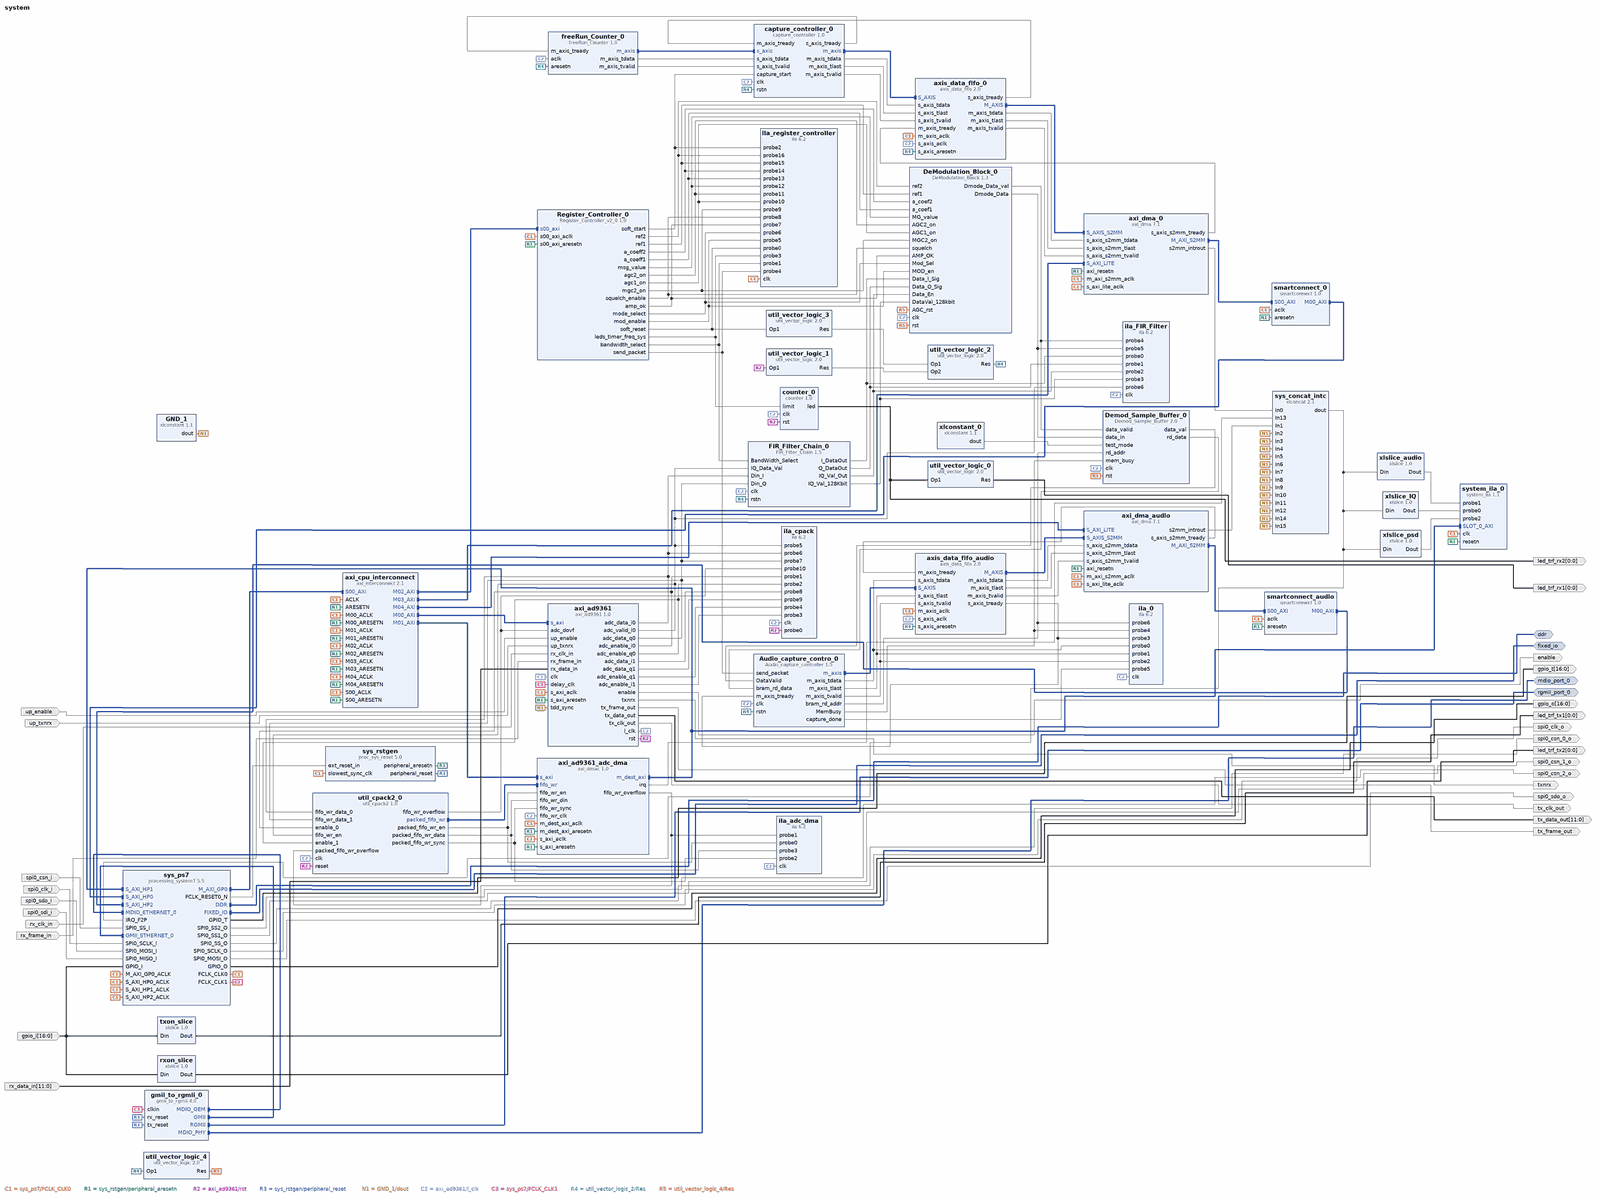
[diagram p0: block diagram of the top level, whole]
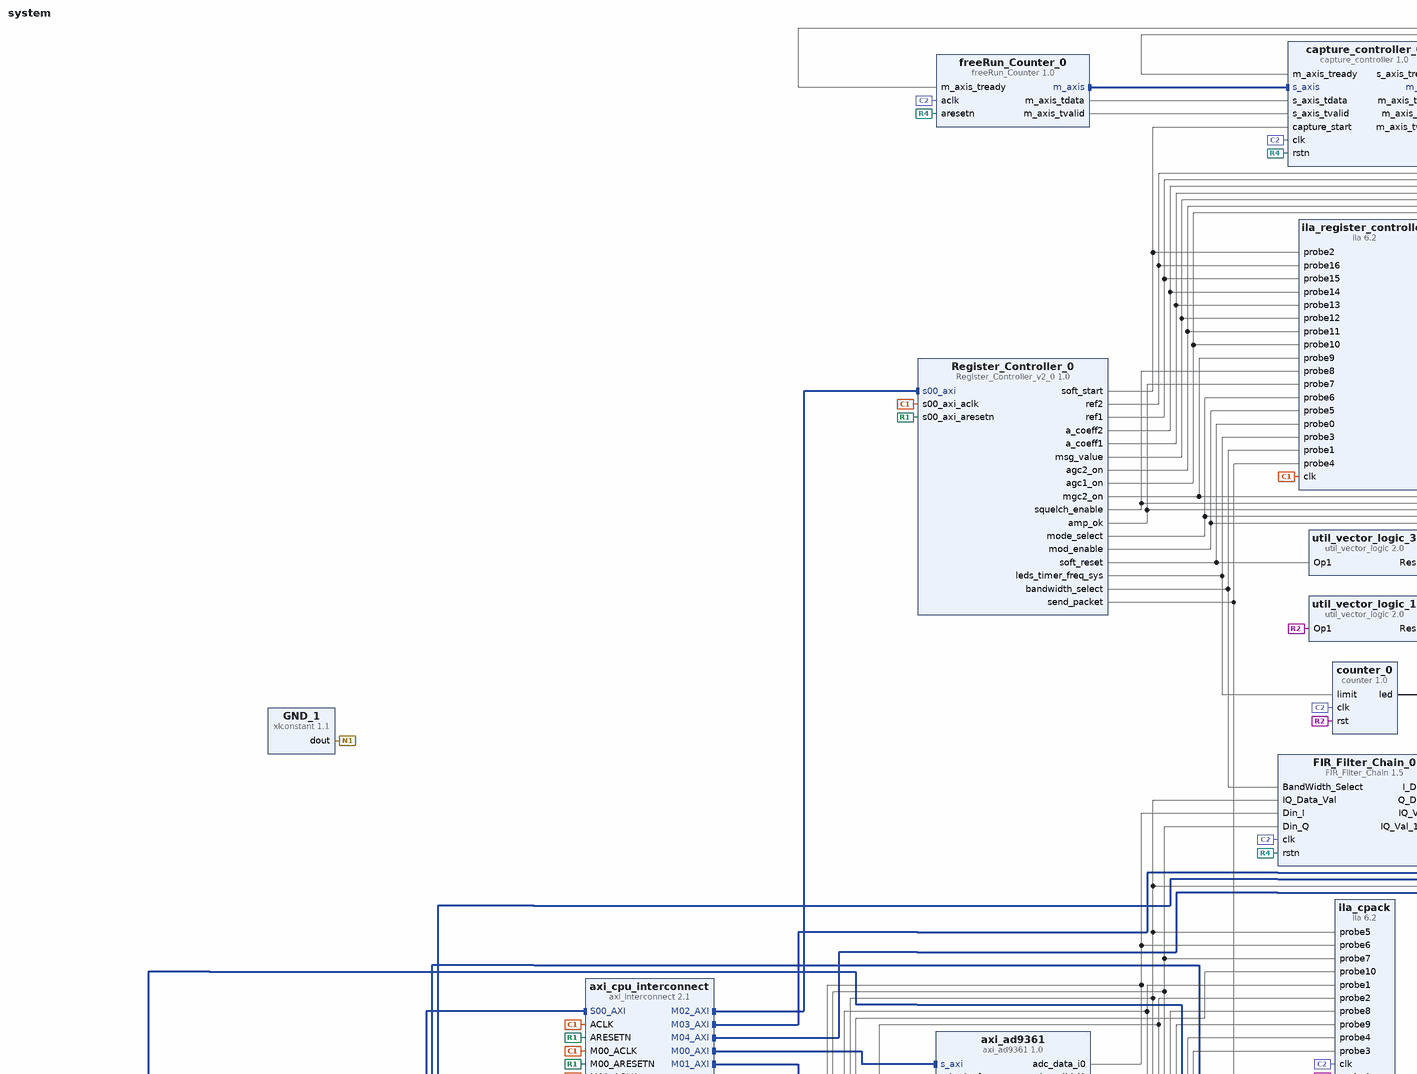
[diagram p1: block diagram of the top level, upper left part]
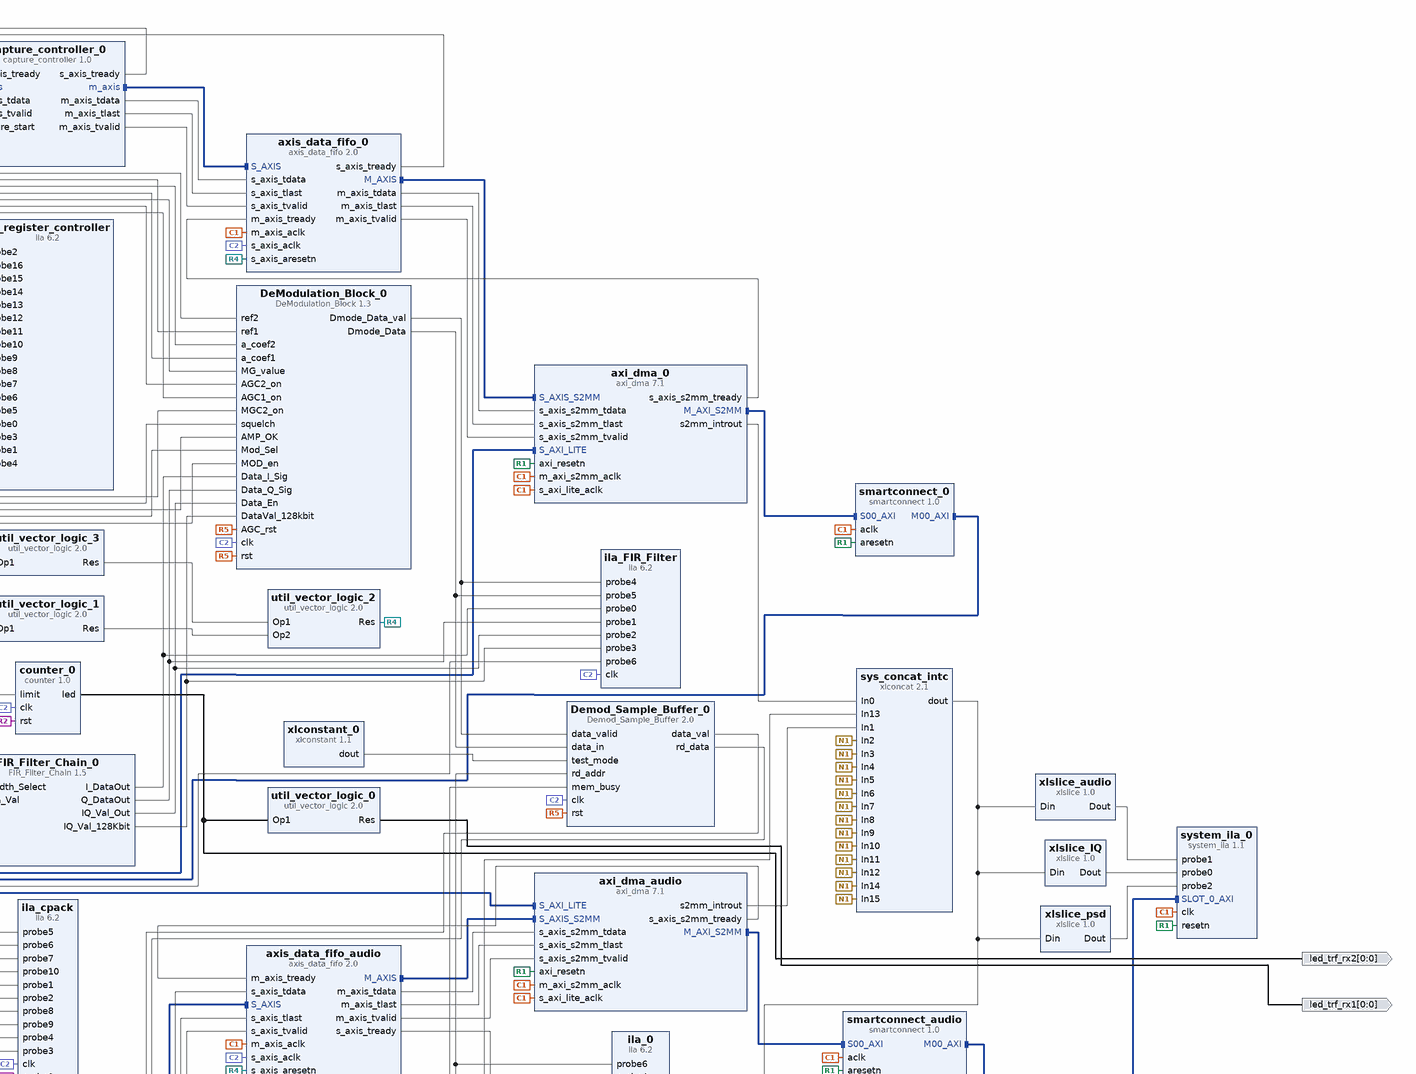
[diagram p2: block diagram of the top level, upper right part]
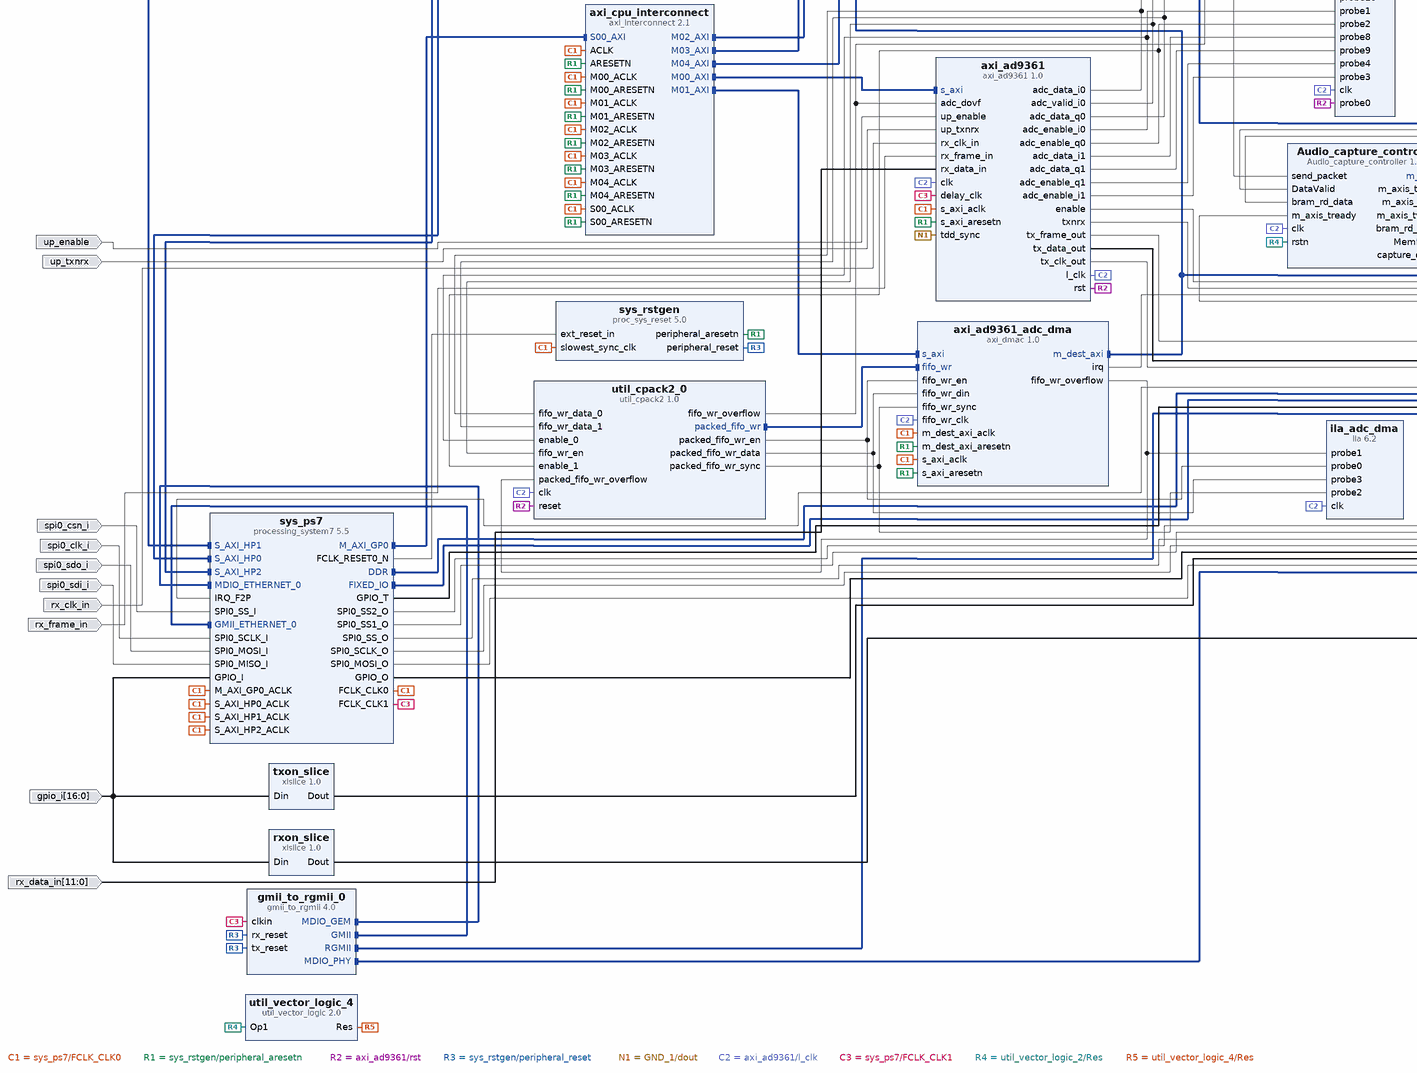
[diagram p3: block diagram of the top level, lower left part]
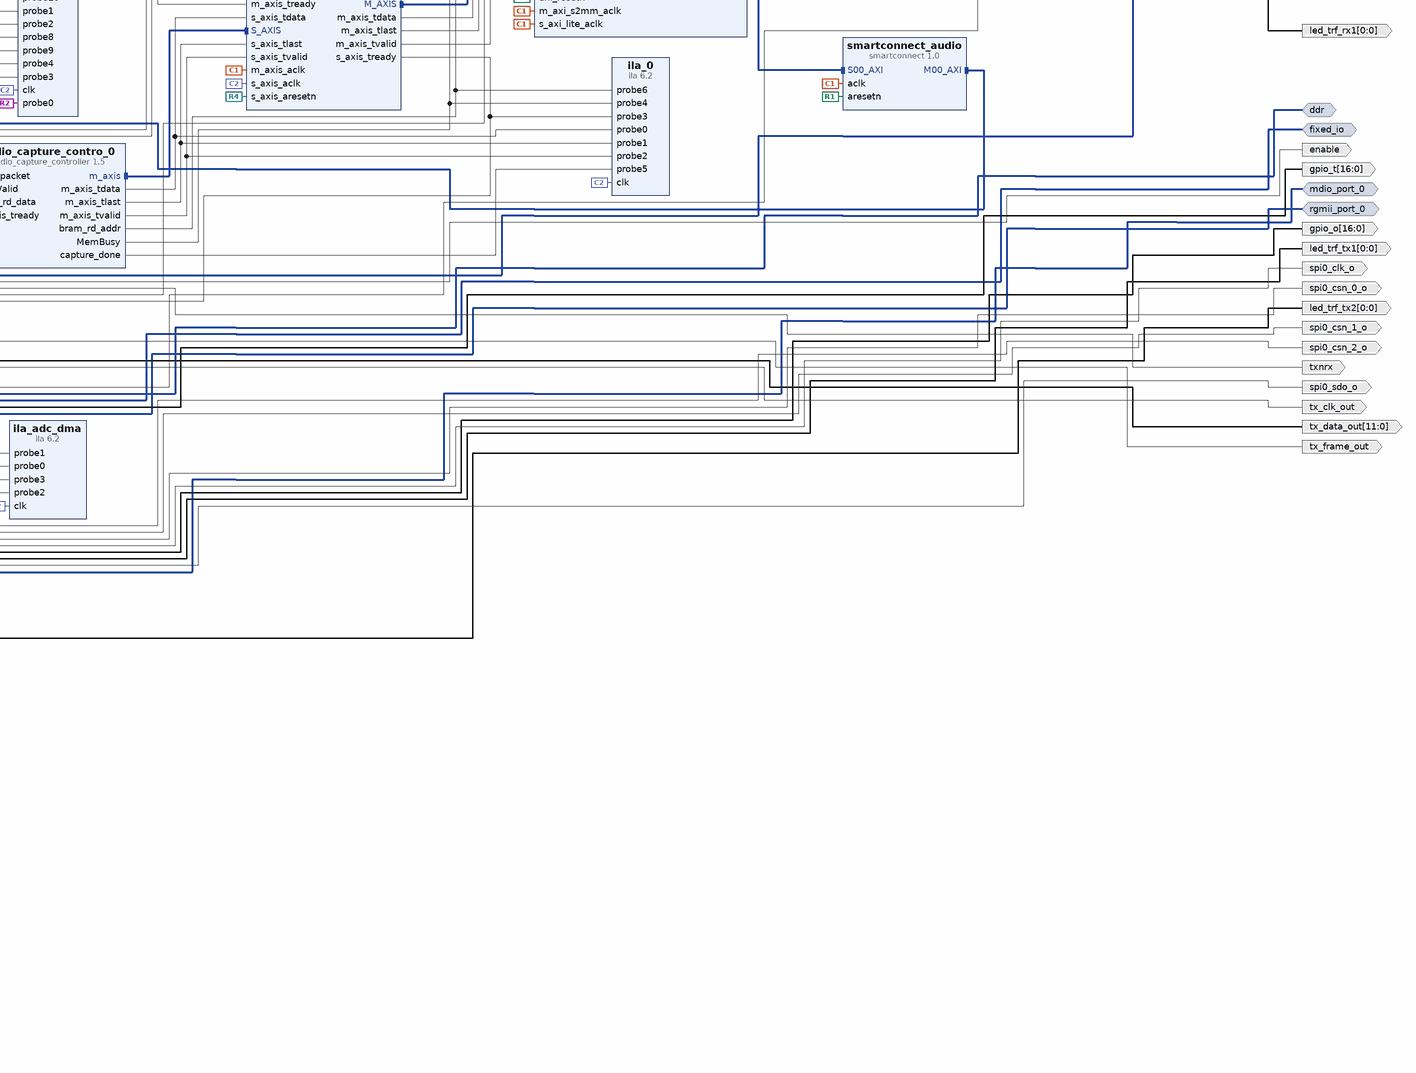
[diagram p4: block diagram of the top level, lower right part]
# Vivado block design system, xc7z020clg400-2, Vivado 2019.2
create_bd_design system

create_bd_intf_port -mode Master -vlnv xilinx.com:interface:ddrx_rtl:1.0 ddr
create_bd_intf_port -mode Master -vlnv xilinx.com:display_processing_system7:fixedio_rtl:1.0 fixed_io
create_bd_intf_port -mode Master -vlnv xilinx.com:interface:mdio_rtl:1.0 mdio_port_0
create_bd_intf_port -mode Master -vlnv xilinx.com:interface:rgmii_rtl:1.0 rgmii_port_0
create_bd_port -dir O spi0_csn_2_o
create_bd_port -dir O spi0_csn_1_o
create_bd_port -dir O spi0_csn_0_o
create_bd_port -dir I spi0_csn_i
create_bd_port -dir I spi0_clk_i
create_bd_port -dir O spi0_clk_o
create_bd_port -dir I spi0_sdo_i
create_bd_port -dir O spi0_sdo_o
create_bd_port -dir I spi0_sdi_i
create_bd_port -dir I -from 16 -to 0 gpio_i
create_bd_port -dir O -from 16 -to 0 gpio_t
create_bd_port -dir I rx_clk_in
create_bd_port -dir I rx_frame_in
create_bd_port -dir O tx_clk_out
create_bd_port -dir O tx_frame_out
create_bd_port -dir O enable
create_bd_port -dir O txnrx
create_bd_port -dir I up_enable
create_bd_port -dir I up_txnrx
create_bd_port -dir O -from 16 -to 0 gpio_o
create_bd_port -dir O -from 0 -to 0 led_trf_tx2
create_bd_port -dir O -from 0 -to 0 led_trf_tx1
create_bd_port -dir I -from 11 -to 0 rx_data_in
create_bd_port -dir O -from 11 -to 0 tx_data_out
create_bd_port -dir O -from 0 -to 0 led_trf_rx2
create_bd_port -dir O -from 0 -to 0 led_trf_rx1

create_bd_cell -type ip -vlnv analog.com:user:axi_ad9361:1.0 axi_ad9361
set_property -dict [list \
  CONFIG.ADC_INIT_DELAY 21 \
  CONFIG.CMOS_OR_LVDS_N 1 \
  CONFIG.DEV_PACKAGE 3 \
  CONFIG.FPGA_FAMILY 4 \
  CONFIG.FPGA_TECHNOLOGY 1 \
  CONFIG.ID 0 \
  CONFIG.MODE_1R1T 0 \
  CONFIG.SPEED_GRADE 20 \
] [get_bd_cells axi_ad9361]
create_bd_cell -type ip -vlnv xilinx.com:ip:axi_interconnect:2.1 axi_cpu_interconnect
set_property -dict {CONFIG.NUM_MI 5} [get_bd_cells axi_cpu_interconnect]
create_bd_cell -type ip -vlnv xilinx.com:ip:processing_system7:5.5 sys_ps7
set_property -dict [list \
  CONFIG.PCW_APU_PERIPHERAL_FREQMHZ 666.666666 \
  CONFIG.PCW_CPU_CPU_6X4X_MAX_RANGE 767 \
  CONFIG.PCW_ENET0_ENET0_IO EMIO \
  CONFIG.PCW_ENET0_GRP_MDIO_ENABLE 1 \
  CONFIG.PCW_ENET0_GRP_MDIO_IO EMIO \
  CONFIG.PCW_ENET0_PERIPHERAL_ENABLE 1 \
  CONFIG.PCW_ENET0_RESET_ENABLE 1 \
  CONFIG.PCW_ENET0_RESET_IO {MIO 7} \
  CONFIG.PCW_ENET_RESET_ENABLE 1 \
  CONFIG.PCW_ENET_RESET_SELECT {Share reset pin} \
  CONFIG.PCW_EN_CLK1_PORT 1 \
  CONFIG.PCW_EN_RST1_PORT 1 \
  CONFIG.PCW_FCLK_CLK1_BUF TRUE \
  CONFIG.PCW_FPGA0_PERIPHERAL_FREQMHZ 100.0 \
  CONFIG.PCW_FPGA1_PERIPHERAL_FREQMHZ 200.0 \
  CONFIG.PCW_FPGA2_PERIPHERAL_FREQMHZ 200.0 \
  CONFIG.PCW_FPGA_FCLK1_ENABLE 1 \
  CONFIG.PCW_GPIO_EMIO_GPIO_ENABLE 1 \
  CONFIG.PCW_GPIO_EMIO_GPIO_IO 17 \
  CONFIG.PCW_GPIO_EMIO_GPIO_WIDTH 17 \
  CONFIG.PCW_GPIO_MIO_GPIO_ENABLE 1 \
  CONFIG.PCW_GPIO_MIO_GPIO_IO MIO \
  CONFIG.PCW_I2C_RESET_ENABLE 1 \
  CONFIG.PCW_IRQ_F2P_INTR 1 \
  CONFIG.PCW_IRQ_F2P_MODE REVERSE \
  CONFIG.PCW_PERIPHERAL_BOARD_PRESET None \
  CONFIG.PCW_PRESET_BANK1_VOLTAGE {LVCMOS 1.8V} \
  CONFIG.PCW_QSPI_GRP_SINGLE_SS_ENABLE 1 \
  CONFIG.PCW_QSPI_GRP_SINGLE_SS_IO {MIO 1 .. 6} \
  CONFIG.PCW_QSPI_PERIPHERAL_ENABLE 1 \
  CONFIG.PCW_QSPI_QSPI_IO {MIO 1 .. 6} \
  CONFIG.PCW_SD0_GRP_CD_ENABLE 0 \
  CONFIG.PCW_SD0_GRP_WP_ENABLE 0 \
  CONFIG.PCW_SD0_PERIPHERAL_ENABLE 1 \
  CONFIG.PCW_SD0_SD0_IO {MIO 40 .. 45} \
  CONFIG.PCW_SDIO_PERIPHERAL_FREQMHZ 100 \
  CONFIG.PCW_SINGLE_QSPI_DATA_MODE x4 \
  CONFIG.PCW_SPI0_PERIPHERAL_ENABLE 1 \
  CONFIG.PCW_SPI0_SPI0_IO EMIO \
  CONFIG.PCW_S_AXI_HP0_DATA_WIDTH 32 \
  CONFIG.PCW_S_AXI_HP1_DATA_WIDTH 32 \
  CONFIG.PCW_S_AXI_HP2_DATA_WIDTH 32 \
  CONFIG.PCW_TTC0_PERIPHERAL_ENABLE 1 \
  CONFIG.PCW_TTC0_TTC0_IO EMIO \
  CONFIG.PCW_UART1_PERIPHERAL_ENABLE 1 \
  CONFIG.PCW_UART1_UART1_IO {MIO 12 .. 13} \
  CONFIG.PCW_UART_PERIPHERAL_FREQMHZ 100 \
  CONFIG.PCW_UIPARAM_DDR_FREQ_MHZ 533.333333 \
  CONFIG.PCW_UIPARAM_DDR_PARTNO {MT41K256M16 RE-125} \
  CONFIG.PCW_USB0_PERIPHERAL_ENABLE 1 \
  CONFIG.PCW_USB0_RESET_ENABLE 1 \
  CONFIG.PCW_USB0_RESET_IO {MIO 48} \
  CONFIG.PCW_USB0_USB0_IO {MIO 28 .. 39} \
  CONFIG.PCW_USB_RESET_ENABLE 1 \
  CONFIG.PCW_USB_RESET_SELECT {Share reset pin} \
  CONFIG.PCW_USE_FABRIC_INTERRUPT 1 \
  CONFIG.PCW_USE_S_AXI_HP0 1 \
  CONFIG.PCW_USE_S_AXI_HP1 1 \
  CONFIG.PCW_USE_S_AXI_HP2 1 \
] [get_bd_cells sys_ps7]
# 509 more settings of sys_ps7 are not shown: defaults, MIO pin electricals, DDR timing, and values the tool derives
create_bd_cell -type ip -vlnv xilinx.com:ip:proc_sys_reset:5.0 sys_rstgen
set_property -dict {CONFIG.C_EXT_RST_WIDTH 1} [get_bd_cells sys_rstgen]
create_bd_cell -type ip -vlnv xilinx.com:ip:gmii_to_rgmii:4.0 gmii_to_rgmii_0
set_property -dict [list \
  CONFIG.C_PHYADDR 8 \
  CONFIG.RGMII_TXC_SKEW 0 \
  CONFIG.SupportLevel Include_Shared_Logic_in_Core \
] [get_bd_cells gmii_to_rgmii_0]
create_bd_cell -type ip -vlnv xilinx.com:ip:xlconstant:1.1 GND_1
set_property -dict {CONFIG.CONST_VAL 0 CONFIG.CONST_WIDTH 1} [get_bd_cells GND_1]
create_bd_cell -type ip -vlnv xilinx.com:ip:xlconcat:2.1 sys_concat_intc
set_property -dict {CONFIG.NUM_PORTS 16} [get_bd_cells sys_concat_intc]
create_bd_cell -type ip -vlnv xilinx.com:ip:xlslice:1.0 rxon_slice
set_property -dict {CONFIG.DIN_FROM 4 CONFIG.DIN_TO 4 CONFIG.DIN_WIDTH 17 CONFIG.DOUT_WIDTH 1} [get_bd_cells rxon_slice]
create_bd_cell -type ip -vlnv xilinx.com:ip:xlslice:1.0 txon_slice
set_property -dict {CONFIG.DIN_FROM 4 CONFIG.DIN_TO 4 CONFIG.DIN_WIDTH 17 CONFIG.DOUT_WIDTH 1} [get_bd_cells txon_slice]
create_bd_cell -type ip -vlnv xilinx.com:ip:ila:6.2 ila_cpack
set_property -dict [list \
  CONFIG.C_DATA_DEPTH 2048 \
  CONFIG.C_ENABLE_ILA_AXI_MON false \
  CONFIG.C_INPUT_PIPE_STAGES 1 \
  CONFIG.C_MONITOR_TYPE Native \
  CONFIG.C_NUM_OF_PROBES 11 \
  CONFIG.C_PROBE10_WIDTH 1 \
  CONFIG.C_PROBE5_WIDTH 1 \
  CONFIG.C_PROBE6_WIDTH 16 \
  CONFIG.C_PROBE7_WIDTH 16 \
  CONFIG.C_PROBE8_WIDTH 16 \
  CONFIG.C_PROBE9_WIDTH 16 \
] [get_bd_cells ila_cpack]
create_bd_cell -type ip -vlnv xilinx.com:ip:ila:6.2 ila_adc_dma
set_property -dict [list \
  CONFIG.C_DATA_DEPTH 2048 \
  CONFIG.C_ENABLE_ILA_AXI_MON false \
  CONFIG.C_MONITOR_TYPE Native \
  CONFIG.C_NUM_OF_PROBES 4 \
  CONFIG.C_PROBE3_WIDTH 32 \
] [get_bd_cells ila_adc_dma]
create_bd_cell -type ip -vlnv xilinx.com:ip:system_ila:1.1 system_ila_0
set_property -dict [list \
  CONFIG.C_DATA_DEPTH 2048 \
  CONFIG.C_INPUT_PIPE_STAGES 1 \
  CONFIG.C_MON_TYPE MIX \
  CONFIG.C_NUM_MONITOR_SLOTS 1 \
  CONFIG.C_NUM_OF_PROBES 3 \
] [get_bd_cells system_ila_0]
create_bd_cell -type ip -vlnv analog.com:user:axi_dmac:1.0 axi_ad9361_adc_dma
set_property -dict {CONFIG.DMA_DATA_WIDTH_DEST 32 CONFIG.DMA_DATA_WIDTH_SRC 32} [get_bd_cells axi_ad9361_adc_dma]
create_bd_cell -type ip -vlnv analog.com:user:util_cpack2:1.0 util_cpack2_0
set_property -dict {CONFIG.NUM_OF_CHANNELS 2} [get_bd_cells util_cpack2_0]
create_bd_cell -type ip -vlnv xilinx.com:ip:xlslice:1.0 xlslice_IQ
set_property -dict {CONFIG.DIN_FROM 13 CONFIG.DIN_TO 13 CONFIG.DIN_WIDTH 16 CONFIG.DOUT_WIDTH 1} [get_bd_cells xlslice_IQ]
create_bd_cell -type ip -vlnv xilinx.com:ip:xlslice:1.0 xlslice_audio
set_property -dict {CONFIG.DIN_FROM 1 CONFIG.DIN_TO 1 CONFIG.DIN_WIDTH 16 CONFIG.DOUT_WIDTH 1} [get_bd_cells xlslice_audio]
create_bd_cell -type ip -vlnv xilinx.com:ip:util_vector_logic:2.0 util_vector_logic_0
set_property -dict {CONFIG.C_OPERATION not CONFIG.C_SIZE 1} [get_bd_cells util_vector_logic_0]
create_bd_cell -type ip -vlnv rgc:user:counter:1.0 counter_0
create_bd_cell -type ip -vlnv xilinx.com:ip:util_vector_logic:2.0 util_vector_logic_1
set_property -dict {CONFIG.C_OPERATION not CONFIG.C_SIZE 1} [get_bd_cells util_vector_logic_1]
create_bd_cell -type ip -vlnv xilinx.com:ip:util_vector_logic:2.0 util_vector_logic_2
set_property -dict {CONFIG.C_OPERATION or CONFIG.C_SIZE 1} [get_bd_cells util_vector_logic_2]
create_bd_cell -type ip -vlnv xilinx.com:ip:util_vector_logic:2.0 util_vector_logic_3
set_property -dict {CONFIG.C_OPERATION not CONFIG.C_SIZE 1} [get_bd_cells util_vector_logic_3]
create_bd_cell -type ip -vlnv xilinx.com:ip:axi_dma:7.1 axi_dma_0
set_property -dict [list \
  CONFIG.c_include_mm2s 0 \
  CONFIG.c_include_s2mm 1 \
  CONFIG.c_include_sg 0 \
  CONFIG.c_sg_length_width 23 \
] [get_bd_cells axi_dma_0]
create_bd_cell -type ip -vlnv xilinx.com:ip:smartconnect:1.0 smartconnect_0
set_property -dict {CONFIG.NUM_SI 1} [get_bd_cells smartconnect_0]
create_bd_cell -type ip -vlnv xilinx.com:ip:xlslice:1.0 xlslice_psd
set_property -dict {CONFIG.DIN_FROM 0 CONFIG.DIN_TO 0 CONFIG.DIN_WIDTH 16 CONFIG.DOUT_WIDTH 1} [get_bd_cells xlslice_psd]
create_bd_cell -type ip -vlnv xilinx.com:ip:axis_data_fifo:2.0 axis_data_fifo_0
set_property -dict [list \
  CONFIG.FIFO_DEPTH 4096 \
  CONFIG.HAS_PROG_FULL 0 \
  CONFIG.HAS_RD_DATA_COUNT 1 \
  CONFIG.HAS_TLAST 1 \
  CONFIG.HAS_WR_DATA_COUNT 1 \
  CONFIG.IS_ACLK_ASYNC 1 \
  CONFIG.SYNCHRONIZATION_STAGES 2 \
  CONFIG.TDATA_NUM_BYTES 4 \
] [get_bd_cells axis_data_fifo_0]
create_bd_cell -type ip -vlnv rgc:user:freeRun_Counter:1.0 freeRun_Counter_0
set_property -dict {CONFIG.DATA_WIDTH 32} [get_bd_cells freeRun_Counter_0]
create_bd_cell -type ip -vlnv rgc:user:capture_controller:1.0 capture_controller_0
set_property -dict {CONFIG.DATA_WIDTH 32 CONFIG.SAMPLE_COUNT 2048} [get_bd_cells capture_controller_0]
create_bd_cell -type ip -vlnv xilinx.com:ip:util_vector_logic:2.0 util_vector_logic_4
set_property -dict {CONFIG.C_OPERATION not CONFIG.C_SIZE 1} [get_bd_cells util_vector_logic_4]
create_bd_cell -type ip -vlnv rgc:user:Register_Controller_v2_0:1.0 Register_Controller_0
create_bd_cell -type ip -vlnv xilinx.com:ip:ila:6.2 ila_register_controller
set_property -dict [list \
  CONFIG.C_ENABLE_ILA_AXI_MON false \
  CONFIG.C_MONITOR_TYPE Native \
  CONFIG.C_NUM_OF_PROBES 17 \
  CONFIG.C_PROBE11_WIDTH 1 \
  CONFIG.C_PROBE12_WIDTH 32 \
  CONFIG.C_PROBE13_WIDTH 8 \
  CONFIG.C_PROBE14_WIDTH 8 \
  CONFIG.C_PROBE15_WIDTH 24 \
  CONFIG.C_PROBE16_WIDTH 24 \
  CONFIG.C_PROBE1_WIDTH 4 \
  CONFIG.C_PROBE3_WIDTH 32 \
  CONFIG.C_PROBE6_WIDTH 8 \
] [get_bd_cells ila_register_controller]
create_bd_cell -type ip -vlnv xilinx.com:ip:ila:6.2 ila_FIR_Filter
set_property -dict [list \
  CONFIG.C_ENABLE_ILA_AXI_MON false \
  CONFIG.C_MONITOR_TYPE Native \
  CONFIG.C_NUM_OF_PROBES 7 \
  CONFIG.C_PROBE0_WIDTH 24 \
  CONFIG.C_PROBE1_WIDTH 24 \
  CONFIG.C_PROBE5_WIDTH 16 \
] [get_bd_cells ila_FIR_Filter]
create_bd_cell -type ip -vlnv xilinx.com:ip:axi_dma:7.1 axi_dma_audio
set_property -dict [list \
  CONFIG.c_include_mm2s 0 \
  CONFIG.c_include_sg 0 \
  CONFIG.c_s_axis_s2mm_tdata_width 16 \
  CONFIG.c_sg_length_width 23 \
] [get_bd_cells axi_dma_audio]
create_bd_cell -type ip -vlnv xilinx.com:ip:axis_data_fifo:2.0 axis_data_fifo_audio
set_property -dict [list \
  CONFIG.FIFO_DEPTH 1024 \
  CONFIG.HAS_TLAST 1 \
  CONFIG.IS_ACLK_ASYNC 1 \
  CONFIG.SYNCHRONIZATION_STAGES 2 \
  CONFIG.TDATA_NUM_BYTES 2 \
] [get_bd_cells axis_data_fifo_audio]
create_bd_cell -type ip -vlnv xilinx.com:ip:smartconnect:1.0 smartconnect_audio
set_property -dict {CONFIG.NUM_SI 1} [get_bd_cells smartconnect_audio]
create_bd_cell -type ip -vlnv xilinx.com:ip:ila:6.2 ila_0
set_property -dict [list \
  CONFIG.C_ENABLE_ILA_AXI_MON false \
  CONFIG.C_INPUT_PIPE_STAGES 1 \
  CONFIG.C_MONITOR_TYPE Native \
  CONFIG.C_NUM_OF_PROBES 7 \
  CONFIG.C_PROBE0_WIDTH 16 \
  CONFIG.C_PROBE6_WIDTH 9 \
] [get_bd_cells ila_0]
create_bd_cell -type ip -vlnv xilinx.com:ip:xlconstant:1.1 xlconstant_0
set_property -dict {CONFIG.CONST_VAL 0} [get_bd_cells xlconstant_0]
create_bd_cell -type ip -vlnv rgc:user:Audio_capture_controller:1.5 Audio_capture_contro_0
create_bd_cell -type ip -vlnv rgc:user:FIR_Filter_Chain:1.5 FIR_Filter_Chain_0
create_bd_cell -type ip -vlnv rgc:user:DeModulation_Block:1.3 DeModulation_Block_0
create_bd_cell -type ip -vlnv rgc:user:Demod_Sample_Buffer:2.0 Demod_Sample_Buffer_0

# ---- connections ----

connect_bd_intf_net [get_bd_intf_pins axi_cpu_interconnect/M00_AXI] [get_bd_intf_pins axi_ad9361/s_axi]
connect_bd_intf_net [get_bd_intf_pins capture_controller_0/m_axis] [get_bd_intf_pins axis_data_fifo_0/S_AXIS]
connect_bd_intf_net [get_bd_intf_pins sys_ps7/S_AXI_HP1] [get_bd_intf_pins axi_ad9361_adc_dma/m_dest_axi]
connect_bd_intf_net [get_bd_intf_pins sys_ps7/S_AXI_HP1] [get_bd_intf_pins system_ila_0/SLOT_0_AXI]
connect_bd_intf_net [get_bd_intf_pins util_cpack2_0/packed_fifo_wr] [get_bd_intf_pins axi_ad9361_adc_dma/fifo_wr]
connect_bd_intf_net [get_bd_intf_pins axi_dma_0/S_AXIS_S2MM] [get_bd_intf_pins axis_data_fifo_0/M_AXIS]
connect_bd_intf_net [get_bd_intf_pins axi_ad9361_adc_dma/s_axi] [get_bd_intf_pins axi_cpu_interconnect/M01_AXI]
connect_bd_intf_net [get_bd_intf_pins axi_cpu_interconnect/S00_AXI] [get_bd_intf_pins sys_ps7/M_AXI_GP0]
connect_bd_intf_net [get_bd_intf_pins Audio_capture_contro_0/m_axis] [get_bd_intf_pins axis_data_fifo_audio/S_AXIS]
connect_bd_intf_net [get_bd_intf_pins smartconnect_0/M00_AXI] [get_bd_intf_pins sys_ps7/S_AXI_HP0]
connect_bd_intf_net [get_bd_intf_pins gmii_to_rgmii_0/MDIO_GEM] [get_bd_intf_pins sys_ps7/MDIO_ETHERNET_0]
connect_bd_intf_net [get_bd_intf_pins freeRun_Counter_0/m_axis] [get_bd_intf_pins capture_controller_0/s_axis]
connect_bd_intf_net [get_bd_intf_pins axi_cpu_interconnect/M03_AXI] [get_bd_intf_pins axi_dma_0/S_AXI_LITE]
connect_bd_intf_net [get_bd_intf_pins smartconnect_0/S00_AXI] [get_bd_intf_pins axi_dma_0/M_AXI_S2MM]
connect_bd_intf_net [get_bd_intf_ports rgmii_port_0] [get_bd_intf_pins gmii_to_rgmii_0/RGMII]
connect_bd_intf_net [get_bd_intf_pins axi_cpu_interconnect/M02_AXI] [get_bd_intf_pins Register_Controller_0/s00_axi]
connect_bd_intf_net [get_bd_intf_ports ddr] [get_bd_intf_pins sys_ps7/DDR]
connect_bd_intf_net [get_bd_intf_pins axi_cpu_interconnect/M04_AXI] [get_bd_intf_pins axi_dma_audio/S_AXI_LITE]
connect_bd_intf_net [get_bd_intf_pins smartconnect_audio/M00_AXI] [get_bd_intf_pins sys_ps7/S_AXI_HP2]
connect_bd_intf_net [get_bd_intf_ports mdio_port_0] [get_bd_intf_pins gmii_to_rgmii_0/MDIO_PHY]
connect_bd_intf_net [get_bd_intf_ports fixed_io] [get_bd_intf_pins sys_ps7/FIXED_IO]
connect_bd_intf_net [get_bd_intf_pins axis_data_fifo_audio/M_AXIS] [get_bd_intf_pins axi_dma_audio/S_AXIS_S2MM]
connect_bd_intf_net [get_bd_intf_pins gmii_to_rgmii_0/GMII] [get_bd_intf_pins sys_ps7/GMII_ETHERNET_0]
connect_bd_intf_net [get_bd_intf_pins axi_dma_audio/M_AXI_S2MM] [get_bd_intf_pins smartconnect_audio/S00_AXI]
connect_bd_net -net sys_cpu_clk [get_bd_pins sys_ps7/FCLK_CLK0] \
  [get_bd_pins axi_ad9361/s_axi_aclk] [get_bd_pins axi_cpu_interconnect/ACLK] [get_bd_pins axi_cpu_interconnect/S00_ACLK] \
  [get_bd_pins axi_cpu_interconnect/M00_ACLK] [get_bd_pins axi_cpu_interconnect/M01_ACLK] \
  [get_bd_pins axi_cpu_interconnect/M02_ACLK] [get_bd_pins sys_ps7/M_AXI_GP0_ACLK] [get_bd_pins sys_rstgen/slowest_sync_clk] \
  [get_bd_pins sys_ps7/S_AXI_HP1_ACLK] [get_bd_pins system_ila_0/clk] [get_bd_pins axi_ad9361_adc_dma/s_axi_aclk] \
  [get_bd_pins axi_ad9361_adc_dma/m_dest_axi_aclk] [get_bd_pins axi_cpu_interconnect/M03_ACLK] \
  [get_bd_pins sys_ps7/S_AXI_HP0_ACLK] [get_bd_pins axi_dma_0/s_axi_lite_aclk] [get_bd_pins smartconnect_0/aclk] \
  [get_bd_pins axi_dma_0/m_axi_s2mm_aclk] [get_bd_pins axis_data_fifo_0/m_axis_aclk] \
  [get_bd_pins Register_Controller_0/s00_axi_aclk] [get_bd_pins ila_register_controller/clk] \
  [get_bd_pins axis_data_fifo_audio/m_axis_aclk] [get_bd_pins axi_dma_audio/s_axi_lite_aclk] \
  [get_bd_pins axi_dma_audio/m_axi_s2mm_aclk] [get_bd_pins axi_cpu_interconnect/M04_ACLK] \
  [get_bd_pins smartconnect_audio/aclk] [get_bd_pins sys_ps7/S_AXI_HP2_ACLK]
connect_bd_net -net sys_cpu_resetn [get_bd_pins sys_rstgen/peripheral_aresetn] \
  [get_bd_pins axi_ad9361/s_axi_aresetn] [get_bd_pins axi_cpu_interconnect/ARESETN] \
  [get_bd_pins axi_cpu_interconnect/S00_ARESETN] [get_bd_pins axi_cpu_interconnect/M00_ARESETN] \
  [get_bd_pins axi_cpu_interconnect/M01_ARESETN] [get_bd_pins axi_cpu_interconnect/M02_ARESETN] \
  [get_bd_pins system_ila_0/resetn] [get_bd_pins axi_ad9361_adc_dma/m_dest_axi_aresetn] \
  [get_bd_pins axi_ad9361_adc_dma/s_axi_aresetn] [get_bd_pins axi_cpu_interconnect/M03_ARESETN] \
  [get_bd_pins axi_dma_0/axi_resetn] [get_bd_pins smartconnect_0/aresetn] [get_bd_pins Register_Controller_0/s00_axi_aresetn] \
  [get_bd_pins axi_dma_audio/axi_resetn] [get_bd_pins axi_cpu_interconnect/M04_ARESETN] \
  [get_bd_pins smartconnect_audio/aresetn]
connect_bd_net [get_bd_pins sys_ps7/FCLK_RESET0_N] [get_bd_pins sys_rstgen/ext_reset_in]
connect_bd_net [get_bd_ports gpio_i] [get_bd_pins sys_ps7/GPIO_I] [get_bd_pins rxon_slice/Din] [get_bd_pins txon_slice/Din]
connect_bd_net [get_bd_pins sys_ps7/GPIO_T] [get_bd_ports gpio_t]
connect_bd_net [get_bd_pins sys_ps7/SPI0_SS2_O] [get_bd_ports spi0_csn_2_o]
connect_bd_net [get_bd_pins sys_ps7/SPI0_SS1_O] [get_bd_ports spi0_csn_1_o]
connect_bd_net [get_bd_pins sys_ps7/SPI0_SS_O] [get_bd_ports spi0_csn_0_o]
connect_bd_net [get_bd_ports spi0_csn_i] [get_bd_pins sys_ps7/SPI0_SS_I]
connect_bd_net [get_bd_ports spi0_clk_i] [get_bd_pins sys_ps7/SPI0_SCLK_I]
connect_bd_net [get_bd_pins sys_ps7/SPI0_SCLK_O] [get_bd_ports spi0_clk_o]
connect_bd_net [get_bd_ports spi0_sdo_i] [get_bd_pins sys_ps7/SPI0_MOSI_I]
connect_bd_net [get_bd_pins sys_ps7/SPI0_MOSI_O] [get_bd_ports spi0_sdo_o]
connect_bd_net [get_bd_ports spi0_sdi_i] [get_bd_pins sys_ps7/SPI0_MISO_I]
connect_bd_net [get_bd_pins axi_ad9361/enable] [get_bd_ports enable]
connect_bd_net [get_bd_pins axi_ad9361/txnrx] [get_bd_ports txnrx]
connect_bd_net [get_bd_ports up_enable] [get_bd_pins axi_ad9361/up_enable]
connect_bd_net [get_bd_ports up_txnrx] [get_bd_pins axi_ad9361/up_txnrx]
connect_bd_net [get_bd_pins axi_ad9361/rst] \
  [get_bd_pins ila_cpack/probe0] [get_bd_pins util_cpack2_0/reset] [get_bd_pins counter_0/rst] \
  [get_bd_pins util_vector_logic_1/Op1]
connect_bd_net [get_bd_pins axi_ad9361/adc_data_i1] [get_bd_pins ila_cpack/probe8]
connect_bd_net [get_bd_pins axi_ad9361/adc_data_q1] [get_bd_pins ila_cpack/probe9]
connect_bd_net -net rx_fir_decimator_enable_out_0 [get_bd_pins axi_ad9361/adc_enable_i0] \
  [get_bd_pins ila_cpack/probe1] [get_bd_pins util_cpack2_0/enable_0]
connect_bd_net -net rx_fir_decimator_enable_out_1 [get_bd_pins axi_ad9361/adc_enable_q0] \
  [get_bd_pins ila_cpack/probe2] [get_bd_pins util_cpack2_0/enable_1]
connect_bd_net -net rx_fir_decimator_data_out_0 [get_bd_pins axi_ad9361/adc_data_i0] \
  [get_bd_pins ila_cpack/probe6] [get_bd_pins util_cpack2_0/fifo_wr_data_0] [get_bd_pins FIR_Filter_Chain_0/Din_I]
connect_bd_net -net rx_fir_decimator_data_out_1 [get_bd_pins axi_ad9361/adc_data_q0] \
  [get_bd_pins ila_cpack/probe7] [get_bd_pins util_cpack2_0/fifo_wr_data_1] [get_bd_pins FIR_Filter_Chain_0/Din_Q]
connect_bd_net -net rx_fir_decimator_valid_out_0 [get_bd_pins axi_ad9361/adc_valid_i0] \
  [get_bd_pins ila_cpack/probe5] [get_bd_pins util_cpack2_0/fifo_wr_en] [get_bd_pins FIR_Filter_Chain_0/IQ_Data_Val] \
  [get_bd_pins ila_FIR_Filter/probe6]
connect_bd_net -net cpack_fifo_wr_overflow [get_bd_pins util_cpack2_0/fifo_wr_overflow] \
  [get_bd_pins axi_ad9361/adc_dovf] [get_bd_pins ila_cpack/probe10]
connect_bd_net [get_bd_pins sys_rstgen/peripheral_reset] [get_bd_pins gmii_to_rgmii_0/tx_reset] [get_bd_pins gmii_to_rgmii_0/rx_reset]
connect_bd_net [get_bd_pins GND_1/dout] \
  [get_bd_pins axi_ad9361/tdd_sync] [get_bd_pins sys_concat_intc/In15] [get_bd_pins sys_concat_intc/In3] \
  [get_bd_pins sys_concat_intc/In4] [get_bd_pins sys_concat_intc/In5] [get_bd_pins sys_concat_intc/In14] \
  [get_bd_pins sys_concat_intc/In6] [get_bd_pins sys_concat_intc/In7] [get_bd_pins sys_concat_intc/In8] \
  [get_bd_pins sys_concat_intc/In11] [get_bd_pins sys_concat_intc/In9] [get_bd_pins sys_concat_intc/In10] \
  [get_bd_pins sys_concat_intc/In12] [get_bd_pins sys_concat_intc/In2]
connect_bd_net [get_bd_pins sys_ps7/GPIO_O] [get_bd_ports gpio_o]
connect_bd_net [get_bd_pins sys_concat_intc/dout] \
  [get_bd_pins sys_ps7/IRQ_F2P] [get_bd_pins xlslice_IQ/Din] [get_bd_pins xlslice_audio/Din] [get_bd_pins xlslice_psd/Din]
connect_bd_net [get_bd_pins rxon_slice/Dout] [get_bd_ports led_trf_tx2]
connect_bd_net [get_bd_pins txon_slice/Dout] [get_bd_ports led_trf_tx1]
connect_bd_net [get_bd_pins axi_ad9361/l_clk] \
  [get_bd_pins axi_ad9361/clk] [get_bd_pins ila_cpack/clk] [get_bd_pins ila_adc_dma/clk] \
  [get_bd_pins axi_ad9361_adc_dma/fifo_wr_clk] [get_bd_pins util_cpack2_0/clk] [get_bd_pins counter_0/clk] \
  [get_bd_pins axis_data_fifo_0/s_axis_aclk] [get_bd_pins freeRun_Counter_0/aclk] [get_bd_pins capture_controller_0/clk] \
  [get_bd_pins ila_FIR_Filter/clk] [get_bd_pins axis_data_fifo_audio/s_axis_aclk] [get_bd_pins ila_0/clk] \
  [get_bd_pins Audio_capture_contro_0/clk] [get_bd_pins FIR_Filter_Chain_0/clk] [get_bd_pins DeModulation_Block_0/clk] \
  [get_bd_pins Demod_Sample_Buffer_0/clk]
connect_bd_net [get_bd_ports rx_clk_in] [get_bd_pins axi_ad9361/rx_clk_in]
connect_bd_net [get_bd_ports rx_frame_in] [get_bd_pins axi_ad9361/rx_frame_in]
connect_bd_net -net rx_data_in_0_1 [get_bd_ports rx_data_in] [get_bd_pins axi_ad9361/rx_data_in]
connect_bd_net [get_bd_pins axi_ad9361/tx_frame_out] [get_bd_ports tx_frame_out]
connect_bd_net [get_bd_pins axi_ad9361/tx_data_out] [get_bd_ports tx_data_out]
connect_bd_net [get_bd_pins axi_ad9361/tx_clk_out] [get_bd_ports tx_clk_out]
connect_bd_net [get_bd_pins axi_ad9361/adc_enable_q1] [get_bd_pins ila_cpack/probe4]
connect_bd_net -net cpack_packed_fifo_wr_en [get_bd_pins util_cpack2_0/packed_fifo_wr_en] \
  [get_bd_pins ila_adc_dma/probe0] [get_bd_pins axi_ad9361_adc_dma/fifo_wr_en]
connect_bd_net -net cpack_packed_fifo_wr_data [get_bd_pins util_cpack2_0/packed_fifo_wr_data] \
  [get_bd_pins ila_adc_dma/probe3] [get_bd_pins axi_ad9361_adc_dma/fifo_wr_din]
connect_bd_net [get_bd_pins axi_ad9361_adc_dma/fifo_wr_overflow] [get_bd_pins ila_adc_dma/probe1] [get_bd_pins util_cpack2_0/packed_fifo_wr_overflow]
connect_bd_net -net cpack_packed_fifo_wr_sync [get_bd_pins util_cpack2_0/packed_fifo_wr_sync] \
  [get_bd_pins ila_adc_dma/probe2] [get_bd_pins axi_ad9361_adc_dma/fifo_wr_sync]
connect_bd_net [get_bd_pins sys_ps7/FCLK_CLK1] [get_bd_pins gmii_to_rgmii_0/clkin] [get_bd_pins axi_ad9361/delay_clk]
connect_bd_net [get_bd_pins axi_ad9361_adc_dma/irq] [get_bd_pins sys_concat_intc/In13]
connect_bd_net [get_bd_pins axi_ad9361/adc_enable_i1] [get_bd_pins ila_cpack/probe3]
connect_bd_net -net xlslice_0_Dout [get_bd_pins xlslice_IQ/Dout] [get_bd_pins system_ila_0/probe0]
connect_bd_net -net xlslice_1_Dout [get_bd_pins xlslice_audio/Dout] [get_bd_pins system_ila_0/probe1]
connect_bd_net [get_bd_pins Register_Controller_0/leds_timer_freq_sys] [get_bd_pins counter_0/limit] [get_bd_pins ila_register_controller/probe3]
connect_bd_net [get_bd_pins counter_0/led] [get_bd_pins util_vector_logic_0/Op1] [get_bd_ports led_trf_rx2]
connect_bd_net [get_bd_pins util_vector_logic_0/Res] [get_bd_ports led_trf_rx1]
connect_bd_net [get_bd_pins Register_Controller_0/soft_reset] [get_bd_pins util_vector_logic_3/Op1] [get_bd_pins ila_register_controller/probe0]
connect_bd_net [get_bd_pins util_vector_logic_1/Res] [get_bd_pins util_vector_logic_2/Op2]
connect_bd_net [get_bd_pins util_vector_logic_2/Res] \
  [get_bd_pins axis_data_fifo_0/s_axis_aresetn] [get_bd_pins freeRun_Counter_0/aresetn] \
  [get_bd_pins capture_controller_0/rstn] [get_bd_pins util_vector_logic_4/Op1] \
  [get_bd_pins axis_data_fifo_audio/s_axis_aresetn] [get_bd_pins Audio_capture_contro_0/rstn] \
  [get_bd_pins FIR_Filter_Chain_0/rstn]
connect_bd_net [get_bd_pins util_vector_logic_3/Res] [get_bd_pins util_vector_logic_2/Op1]
connect_bd_net [get_bd_pins axi_dma_0/s2mm_introut] [get_bd_pins sys_concat_intc/In0]
connect_bd_net [get_bd_pins axi_dma_0/s_axis_s2mm_tready] [get_bd_pins axis_data_fifo_0/m_axis_tready]
connect_bd_net -net xlslice_2_Dout [get_bd_pins xlslice_psd/Dout] [get_bd_pins system_ila_0/probe2]
connect_bd_net [get_bd_pins axis_data_fifo_0/m_axis_tdata] [get_bd_pins axi_dma_0/s_axis_s2mm_tdata]
connect_bd_net [get_bd_pins axis_data_fifo_0/m_axis_tlast] [get_bd_pins axi_dma_0/s_axis_s2mm_tlast]
connect_bd_net [get_bd_pins axis_data_fifo_0/m_axis_tvalid] [get_bd_pins axi_dma_0/s_axis_s2mm_tvalid]
connect_bd_net [get_bd_pins freeRun_Counter_0/m_axis_tdata] [get_bd_pins capture_controller_0/s_axis_tdata]
connect_bd_net [get_bd_pins freeRun_Counter_0/m_axis_tvalid] [get_bd_pins capture_controller_0/s_axis_tvalid]
connect_bd_net [get_bd_pins capture_controller_0/s_axis_tready] [get_bd_pins freeRun_Counter_0/m_axis_tready]
connect_bd_net [get_bd_pins Register_Controller_0/bandwidth_select] \
  [get_bd_pins ila_register_controller/probe1] [get_bd_pins FIR_Filter_Chain_0/BandWidth_Select]
connect_bd_net [get_bd_pins util_vector_logic_4/Res] \
  [get_bd_pins DeModulation_Block_0/rst] [get_bd_pins DeModulation_Block_0/AGC_rst] [get_bd_pins Demod_Sample_Buffer_0/rst]
connect_bd_net [get_bd_pins FIR_Filter_Chain_0/I_DataOut] [get_bd_pins ila_FIR_Filter/probe0] [get_bd_pins DeModulation_Block_0/Data_I_Sig]
connect_bd_net [get_bd_pins FIR_Filter_Chain_0/Q_DataOut] [get_bd_pins ila_FIR_Filter/probe1] [get_bd_pins DeModulation_Block_0/Data_Q_Sig]
connect_bd_net [get_bd_pins FIR_Filter_Chain_0/IQ_Val_Out] [get_bd_pins ila_FIR_Filter/probe2] [get_bd_pins DeModulation_Block_0/Data_En]
connect_bd_net [get_bd_pins FIR_Filter_Chain_0/IQ_Val_128Kbit] [get_bd_pins ila_FIR_Filter/probe3] [get_bd_pins DeModulation_Block_0/DataVal_128kbit]
connect_bd_net [get_bd_pins Register_Controller_0/ref2] [get_bd_pins ila_register_controller/probe16] [get_bd_pins DeModulation_Block_0/ref2]
connect_bd_net [get_bd_pins Register_Controller_0/ref1] [get_bd_pins ila_register_controller/probe15] [get_bd_pins DeModulation_Block_0/ref1]
connect_bd_net [get_bd_pins Register_Controller_0/a_coeff2] [get_bd_pins ila_register_controller/probe14] [get_bd_pins DeModulation_Block_0/a_coef2]
connect_bd_net [get_bd_pins Register_Controller_0/a_coeff1] [get_bd_pins ila_register_controller/probe13] [get_bd_pins DeModulation_Block_0/a_coef1]
connect_bd_net [get_bd_pins Register_Controller_0/msg_value] [get_bd_pins ila_register_controller/probe12] [get_bd_pins DeModulation_Block_0/MG_value]
connect_bd_net [get_bd_pins Register_Controller_0/agc2_on] [get_bd_pins ila_register_controller/probe11] [get_bd_pins DeModulation_Block_0/AGC2_on]
connect_bd_net [get_bd_pins Register_Controller_0/agc1_on] [get_bd_pins ila_register_controller/probe10] [get_bd_pins DeModulation_Block_0/AGC1_on]
connect_bd_net [get_bd_pins Register_Controller_0/mgc2_on] [get_bd_pins ila_register_controller/probe9] [get_bd_pins DeModulation_Block_0/MGC2_on]
connect_bd_net [get_bd_pins Register_Controller_0/squelch_enable] \
  [get_bd_pins ila_register_controller/probe8] [get_bd_pins DeModulation_Block_0/squelch]
connect_bd_net [get_bd_pins Register_Controller_0/amp_ok] [get_bd_pins ila_register_controller/probe7] [get_bd_pins DeModulation_Block_0/AMP_OK]
connect_bd_net [get_bd_pins Register_Controller_0/mode_select] [get_bd_pins ila_register_controller/probe6] [get_bd_pins DeModulation_Block_0/Mod_Sel]
connect_bd_net [get_bd_pins Register_Controller_0/mod_enable] [get_bd_pins ila_register_controller/probe5] [get_bd_pins DeModulation_Block_0/MOD_en]
connect_bd_net [get_bd_pins Register_Controller_0/send_packet] \
  [get_bd_pins ila_register_controller/probe4] [get_bd_pins Audio_capture_contro_0/send_packet]
connect_bd_net [get_bd_pins capture_controller_0/m_axis_tdata] [get_bd_pins axis_data_fifo_0/s_axis_tdata]
connect_bd_net [get_bd_pins capture_controller_0/m_axis_tlast] [get_bd_pins axis_data_fifo_0/s_axis_tlast]
connect_bd_net [get_bd_pins capture_controller_0/m_axis_tvalid] [get_bd_pins axis_data_fifo_0/s_axis_tvalid]
connect_bd_net [get_bd_pins axis_data_fifo_0/s_axis_tready] [get_bd_pins capture_controller_0/m_axis_tready]
connect_bd_net [get_bd_pins Register_Controller_0/soft_start] \
  [get_bd_pins ila_register_controller/probe2] [get_bd_pins capture_controller_0/capture_start]
connect_bd_net [get_bd_pins DeModulation_Block_0/Dmode_Data_val] [get_bd_pins ila_FIR_Filter/probe4] [get_bd_pins Demod_Sample_Buffer_0/data_valid]
connect_bd_net [get_bd_pins DeModulation_Block_0/Dmode_Data] [get_bd_pins ila_FIR_Filter/probe5] [get_bd_pins Demod_Sample_Buffer_0/data_in]
connect_bd_net [get_bd_pins Demod_Sample_Buffer_0/data_val] [get_bd_pins Audio_capture_contro_0/DataValid]
connect_bd_net [get_bd_pins Demod_Sample_Buffer_0/rd_data] [get_bd_pins Audio_capture_contro_0/bram_rd_data]
connect_bd_net [get_bd_pins Audio_capture_contro_0/bram_rd_addr] [get_bd_pins ila_0/probe6] [get_bd_pins Demod_Sample_Buffer_0/rd_addr]
connect_bd_net [get_bd_pins Audio_capture_contro_0/MemBusy] [get_bd_pins ila_0/probe4] [get_bd_pins Demod_Sample_Buffer_0/mem_busy]
connect_bd_net [get_bd_pins Audio_capture_contro_0/m_axis_tdata] [get_bd_pins axis_data_fifo_audio/s_axis_tdata] [get_bd_pins ila_0/probe0]
connect_bd_net [get_bd_pins Audio_capture_contro_0/m_axis_tlast] [get_bd_pins axis_data_fifo_audio/s_axis_tlast] [get_bd_pins ila_0/probe1]
connect_bd_net [get_bd_pins Audio_capture_contro_0/m_axis_tvalid] [get_bd_pins axis_data_fifo_audio/s_axis_tvalid] [get_bd_pins ila_0/probe2]
connect_bd_net [get_bd_pins axis_data_fifo_audio/s_axis_tready] [get_bd_pins ila_0/probe3] [get_bd_pins Audio_capture_contro_0/m_axis_tready]
connect_bd_net [get_bd_pins axis_data_fifo_audio/m_axis_tdata] [get_bd_pins axi_dma_audio/s_axis_s2mm_tdata]
connect_bd_net [get_bd_pins axis_data_fifo_audio/m_axis_tlast] [get_bd_pins axi_dma_audio/s_axis_s2mm_tlast]
connect_bd_net [get_bd_pins axi_dma_audio/s_axis_s2mm_tready] [get_bd_pins axis_data_fifo_audio/m_axis_tready]
connect_bd_net [get_bd_pins axis_data_fifo_audio/m_axis_tvalid] [get_bd_pins axi_dma_audio/s_axis_s2mm_tvalid]
connect_bd_net [get_bd_pins axi_dma_audio/s2mm_introut] [get_bd_pins sys_concat_intc/In1]
connect_bd_net [get_bd_pins Audio_capture_contro_0/capture_done] [get_bd_pins ila_0/probe5]
connect_bd_net [get_bd_pins xlconstant_0/dout] [get_bd_pins Demod_Sample_Buffer_0/test_mode]

# ---- address map ----
assign_bd_address -offset 0x00000000 -range 1G -target_address_space [get_bd_addr_spaces axi_ad9361_adc_dma/m_dest_axi] [get_bd_addr_segs sys_ps7/S_AXI_HP1/HP1_DDR_LOWOCM]
assign_bd_address -offset 0x00000000 -range 1G -target_address_space [get_bd_addr_spaces axi_dma_0/Data_S2MM] [get_bd_addr_segs sys_ps7/S_AXI_HP0/HP0_DDR_LOWOCM]
assign_bd_address -offset 0x00000000 -range 1G -target_address_space [get_bd_addr_spaces axi_dma_audio/Data_S2MM] [get_bd_addr_segs sys_ps7/S_AXI_HP2/HP2_DDR_LOWOCM]
assign_bd_address -offset 0x40400000 -range 64K -target_address_space [get_bd_addr_spaces sys_ps7/Data] [get_bd_addr_segs axi_dma_0/S_AXI_LITE/Reg]
assign_bd_address -offset 0x40410000 -range 64K -target_address_space [get_bd_addr_spaces sys_ps7/Data] [get_bd_addr_segs axi_dma_audio/S_AXI_LITE/Reg]
assign_bd_address -offset 0x43C00000 -range 64K -target_address_space [get_bd_addr_spaces sys_ps7/Data] [get_bd_addr_segs Register_Controller_0/s00_axi/reg0]
assign_bd_address -offset 0x79020000 -range 64K -target_address_space [get_bd_addr_spaces sys_ps7/Data] [get_bd_addr_segs axi_ad9361/s_axi/axi_lite]
assign_bd_address -offset 0x7C400000 -range 4K -target_address_space [get_bd_addr_spaces sys_ps7/Data] [get_bd_addr_segs axi_ad9361_adc_dma/s_axi/axi_lite]

validate_bd_design
save_bd_design
